# Altium schematic sheet MEASURES.SchDoc
size A4; SheetNumber: 4; SheetTotal: 6
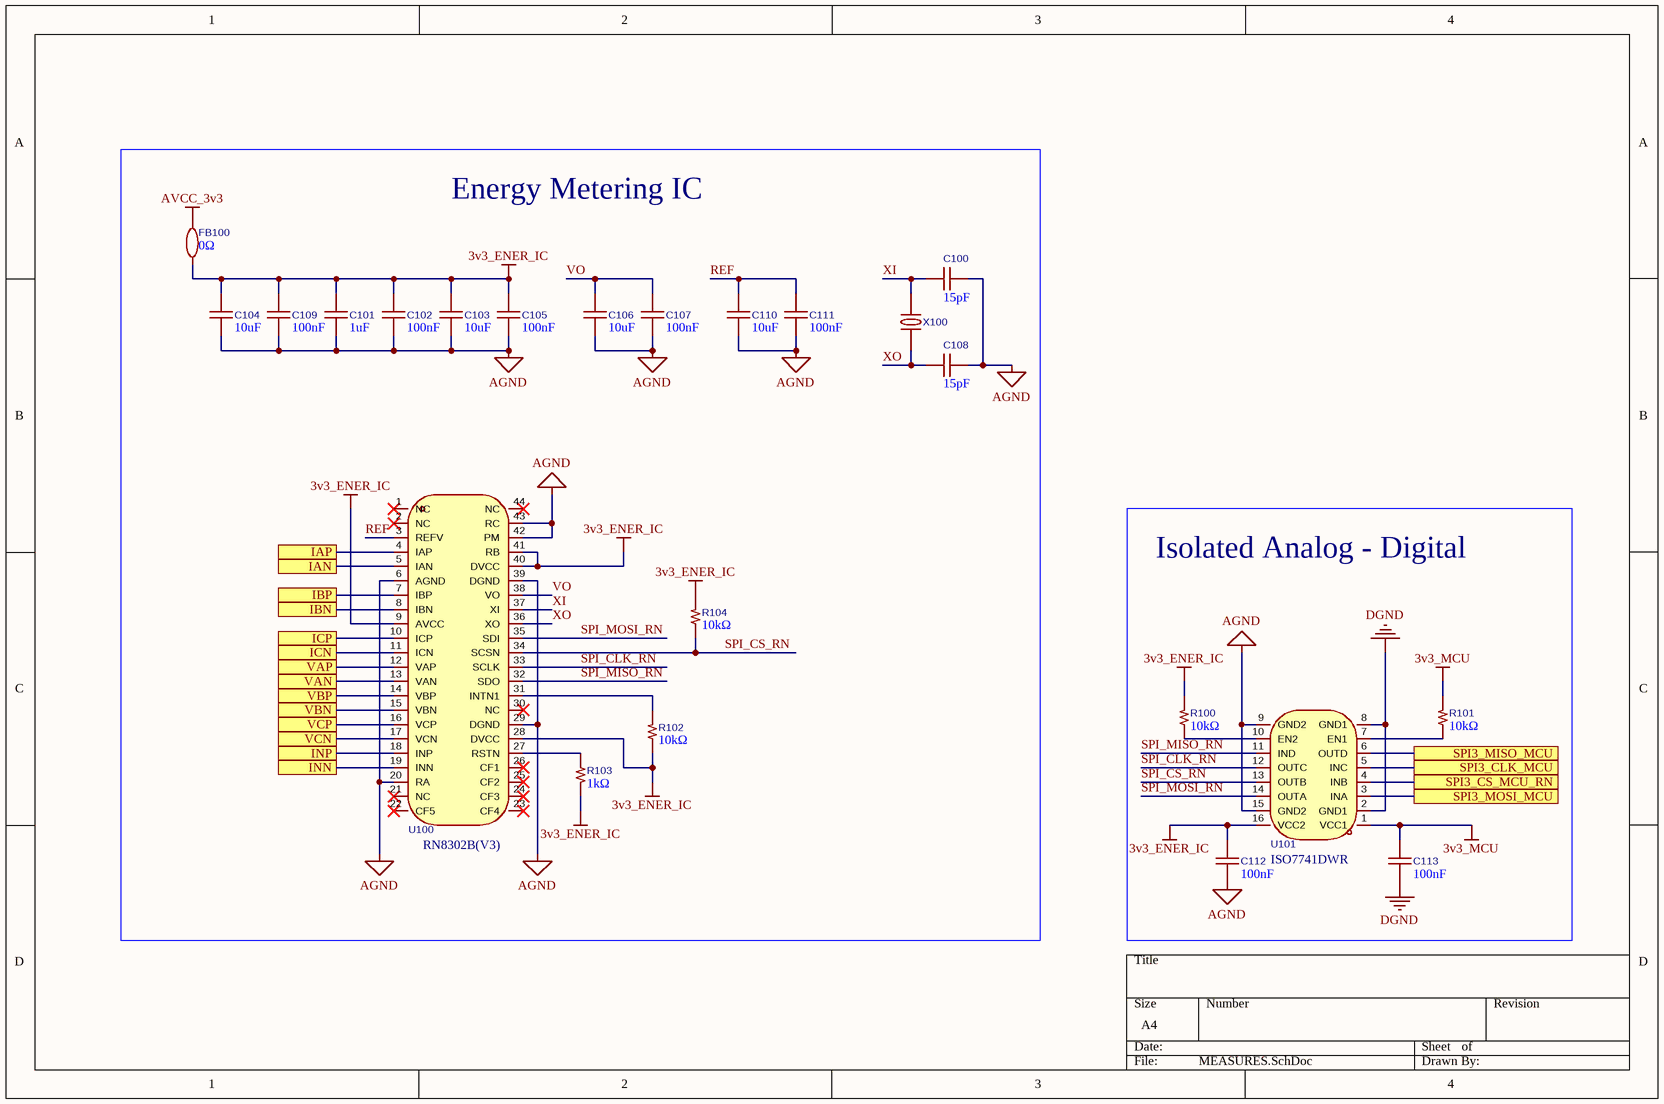
[diagram p0: MEASURES.SchDoc]

## Parts
C100  value 15pF  [0603_cap]  (hidden comment: YAGEO CC0603JRNPO9BN150)
C101  value 1uF  [0603_cap]  (hidden comment: CL10B105KB8NQNC)
C102  value 100nF  [0603_cap]  (hidden comment: AIDE CAPACITOR 0603X7R104K250NT)
C103  value 10uF  [0805_cap]  (hidden comment: muRata GRM21BR61C106KE15L)
C104  value 10uF  [0805_cap]  (hidden comment: muRata GRM21BR61C106KE15L)
C105  value 100nF  [0603_cap]  (hidden comment: AIDE CAPACITOR 0603X7R104K250NT)
C106  value 10uF  [0805_cap]  (hidden comment: muRata GRM21BR61C106KE15L)
C107  value 100nF  [0603_cap]  (hidden comment: AIDE CAPACITOR 0603X7R104K250NT)
C108  value 15pF  [0603_cap]  (hidden comment: YAGEO CC0603JRNPO9BN150)
C109  value 100nF  [0603_cap]  (hidden comment: AIDE CAPACITOR 0603X7R104K250NT)
C110  value 10uF  [0805_cap]  (hidden comment: muRata GRM21BR61C106KE15L)
C111  value 100nF  [0603_cap]  (hidden comment: AIDE CAPACITOR 0603X7R104K250NT)
C112  value 100nF  [0603_cap]  (hidden comment: AIDE CAPACITOR 0603X7R104K250NT)
C113  value 100nF  [0603_cap]  (hidden comment: AIDE CAPACITOR 0603X7R104K250NT)
FB100  value 0Ω  [0603_cap]  (hidden comment: Yanchuang SCBM160808U090T)
R100  value 10kΩ  [0603_RES]  (hidden comment: SAE 1RC0603F1002)
R101  value 10kΩ  [0603_RES]  (hidden comment: SAE 1RC0603F1002)
R102  value 10kΩ  [0603_RES]  (hidden comment: SAE 1RC0603F1002)
R103  value 1kΩ  [0603_RES]  (hidden comment: FOJAN FRC0603F1001TS)
R104  value 10kΩ  [0603_RES]  (hidden comment: SAE 1RC0603F1002)
U100  RN8302B(v3)  [3]
U101  C571196  [SOIC-16_L10.3-W7.5-P1.27-LS10.3-BL]  (value not drawn)
X100  049ss2-8.192f12dzlal  [HC-49S_L11.4-W4.7-LS12.7]  (value not drawn)

## Blocks framed on the sheet
Energy Metering IC: C100-C111 FB100 R102-R104 U100 X100
Isolated Analog - Digital: C112 C113 R100 R101 U101

## Ports
IAN (see MAIN[2C], THREE PHASES[4B]), IAP (see MAIN[2C], THREE PHASES[4A]), IBN (see MAIN[2C], THREE PHASES[4B]), IBP (see MAIN[2C], THREE PHASES[4B]), ICN (see MAIN[2C], THREE PHASES[4C]), ICP (see MAIN[2C], THREE PHASES[4C]), INN (see MAIN[2C], THREE PHASES[4D]), INP (see MAIN[2C], THREE PHASES[4C]), SPI3_CLK_MCU (see MAIN[2C], MCU[3C]), SPI3_CS_MCU_RN (see MAIN[2C], MCU[3C]), SPI3_MISO_MCU (see MAIN[2C], MCU[3C]), SPI3_MOSI_MCU (see MAIN[2C], MCU[3C]), VAN (see MAIN[2B], THREE PHASES[3B]), VAP (see MAIN[2B], THREE PHASES[3B]), VBN (see MAIN[2B], THREE PHASES[3C]), VBP (see MAIN[2B], THREE PHASES[3B]), VCN (see MAIN[2B], THREE PHASES[3C]), VCP (see MAIN[2B], THREE PHASES[3C])

## Nets
3v3_ENER_IC: C101.2 C102.2 C103.2 C104.2 C105.2 C109.2 C112.2 FB100.1 R100.2 R102.1 R103.2 R104.2 U100.9(AVCC) U100.28(DVCC) U100.40(DVCC) U100.41(RB) U101.16(VCC2)
3v3_MCU: C113.2 R101.2 U101.1(VCC1)
AGND: C100.1 C101.1 C102.1 C103.1 C104.1 C105.1 C106.1 C107.1 C108.1 C109.1 C110.1 C111.1 C112.1 U100.6(AGND) U100.20(RA) U100.29(DGND) U100.39(DGND) U100.42(PM) U100.43(RC) U101.9(GND2) U101.15(GND2)
AVCC_3v3: FB100.2
DGND: C113.1 U101.2(GND1) U101.8(GND1)
IAN: U100.5(IAN) ; port IAN
IAP: U100.4(IAP) ; port IAP
IBN: U100.8(IBN) ; port IBN
IBP: U100.7(IBP) ; port IBP
ICN: U100.11(ICN) ; port ICN
ICP: U100.10(ICP) ; port ICP
INN: U100.19(INN) ; port INN
INP: U100.18(INP) ; port INP
REF: C110.2 C111.2 U100.3(REFV)
SPI3_CLK_MCU: U101.5(INC) ; port SPI3_CLK_MCU
SPI3_CS_MCU_RN: U101.4(INB) ; port SPI3_CS_MCU_RN
SPI3_MISO_MCU: U101.6(OUTD) ; port SPI3_MISO_MCU
SPI3_MOSI_MCU: U101.3(INA) ; port SPI3_MOSI_MCU
SPI_CLK_RN: U100.33(SCLK) U101.12(OUTC)
SPI_CS_RN: R104.1 U100.34(SCSN) U101.13(OUTB)
SPI_MISO_RN: U100.32(SDO) U101.11(IND)
SPI_MOSI_RN: U100.35(SDI) U101.14(OUTA)
VAN: U100.13(VAN) ; port VAN
VAP: U100.12(VAP) ; port VAP
VBN: U100.15(VBN) ; port VBN
VBP: U100.14(VBP) ; port VBP
VCN: U100.17(VCN) ; port VCN
VCP: U100.16(VCP) ; port VCP
VO: C106.2 C107.2 U100.38(VO)
XI: C100.2 U100.37(XI) X100.1
XO: C108.2 U100.36(XO) X100.2
NetR100_1: R100.1 U101.10(EN2)
NetR101_1: R101.1 U101.7(EN1)
NetR102_2: R102.2 U100.31(INTN1)
NetR103_1: R103.1 U100.27(RSTN)

Not connected (* = marked no-connect by the designer): U100 1(NC)* 2(NC)* 21(NC)* 22(CF5)* 23(CF4)* 24(CF3)* 25(CF2)* 26(CF1)* 30(NC)* 44(NC)*

## Library data of the parts
C100 C108 = CAP CER 15pF 50V NP0 0603: Capacitance:15pF Tolerance:±5% Tolerance:±5% Voltage Rating:50V Temperature Coefficient:C0G; Manufacturer 1: Chinocera; Manufacturer Part Number 1: HGC0603G0150J500NTHJ; ComponentLink1Description: LCSC; ComponentLink1URL: https://www.lcsc.com/product-detail/C465156.html?s_z=n_q_HGC0603G0150J500NTHJ; Supplier 1: LCSC; Supplier Part Number 1: C465156
C101 = CAP CER 1uF 50V X7R 0603: Capacitance:1uF Tolerance:±20% Tolerance:±20% Voltage Rating:50V Ripple Current:- Equivalent Series Resistance(ESR):- Diameter:4mm Height - Seated (Max):5.4mm Lifetime:1000hrs@105℃ Operating Temperature:-45℃~+105℃ Operating Temperature:-45℃~+105℃; Manufacturer 1: Samsung Electro-Mechanics; ComponentLink1Description: LCSC; ComponentLink1URL: https://www.lcsc.com/es/product-detail/C5199872.html?spm=wm.fly.bg.9.xh&lcsc_vid=ElBYBFACR1JaVQdSQ1NeBFwHFAdfUFIFEwUNXlwCEVQxVlNfRlVWUFNWT1hWUDtW; Supplier 1: LSCS; Supplier Part Number 1: C5199872; Manufacturer Part Number 1: CL10B105KB8NQNC
C102 C105 C107 C109 C111-C113 = CAP CER 100nF 25V X7R 0603: ComponentLink1Description: LCSC; ComponentLink1URL: https://www.lcsc.com/product-detail/C465156.html?s_z=n_q_HGC0603G0150J500NTHJ; Supplier 1: LCSC; Manufacturer 1: AIDE CAPACITOR; Manufacturer Part Number 1: 0603X7R104K250NT; Supplier Part Number 1: C48579280
C103 C104 C106 C110 = CAP CER 10uF 16V X5R 0805: ComponentLink1Description: New link; ComponentLink1URL: https://www.lcsc.com/es/product-detail/C77075.html?spm=wm.fly.bg.11.xh___wm.fly.dhl.mly.13-0-3&lcsc_vid=ElBYBFACR1JaVQdSQ1NeBFwHFAdfUFIFEwUNXlwCEVQxVlNfRlVWUFNWT1hWUDtW; Manufacturer 1: muRata; Manufacturer Part Number 1: GRM21BR61C106KE15L; Supplier Part Number 1: C77075; Supplier 1: LCSC
FB100 = FERR_10mohms 15o@100MHz: 10mΩ 15Ω@100MHz 0603 Ferrite Beads and Chips; ComponentLink1Description: LCSC; ComponentLink1URL: https://www.lcsc.com/es/product-detail/C52205324.html?s_z=s_c_Ferrite%2520Beads%2520and%2520Chips&spm=wm.fly.bg.0.xh&lcsc_vid=T1EMUlBeR1ALUlVSFANeUFcFR1BWV1EHFVFaA1dQElAxVlNfRlJaVFNSQlhYUjsOAxUeFF5JWBYZEEoKFBINSQcJGk4LFEsFFhULAAsUDk5fVlNWWQkaCgg%3D; Supplier 1: LCSC; Supplier Part Number 1: C52205324; Manufacturer 1: Yanchuang; Manufacturer Part Number 1: SCBM160808U090T
R100-R102 R104 = RES_10kohms 100mW 75V: 10kΩ 100mW 75V Thick Film Resistor ±100ppm/℃ ±1% 0603 Chip Resistor - Surface Mount; ComponentLink1Description: New link; ComponentLink1URL: https://www.lcsc.com/es/product-detail/C53224186.html?spm=wm.fly.bg.4.xh___wm.fly.dhl.mly.13-6-1&lcsc_vid=T1EMUlBeR1ALUlVSFANeUFcFR1BWV1EHFVFaA1dQElAxVlNfRlJaV1FUQldbXzsOAxUeFF5JWBYZEEoKFBINSQcJGk4NBhYS; Manufacturer 1: SAE; Manufacturer Part Number 1: 1RC0603F1002; Supplier Part Number 1: C53224186; Supplier 1: LCSC
R103 = RES 1kohms ±1% 100mW 0603: RES 1kΩ ±1% 100mW 0603; ComponentLink1Description: New link; ComponentLink1URL: https://www.lcsc.com/es/product-detail/C2907002.html?spm=wm.fly.bg.1.xh___wm.fly.dhl.mly.13-6-1&lcsc_vid=T1EMUlBeR1ALUlVSFANeUFcFR1BWV1EHFVFaA1dQElAxVlNfRlJaV1FUQldbXzsOAxUeFF5JWBYZEEoKFBINSQcJGk4NBhYS; Supplier 1: LCSC; Supplier Part Number 1: C2907002; Manufacturer Part Number 1: FRC0603F1001TS; Manufacturer 1: FOJAN
U100 = RN8302B(v3): Meter Type:Polyphase Energy Metering IC Number of Channels:- Tolerance:0.1% Voltage - Supply:3V~3.6V Voltage - Supply:3V~3.6V Dynamic Range:10000:1 Interface:SPI Current - Supply:4.4mA Current - Supply:4.4mA Operating Temperature:-40℃~+85℃ Operating Tempe; Manufacturer 1: RENERGY; ComponentLink1Description: LCSC; ComponentLink1URL: https://www.lcsc.com/es/product-detail/C22381391.html?s_z=n_q_rn8302b%28v3%29&spm=wm.fly.bg.0.xh&lcsc_vid=FFRdVwAETgNbVwAHTlRdV1UFEwcIU1ZXQVZZAlYFQAcxVlNfRlJdUlFTRVNXXzsOAxUeFF5JWBYZEEoKFBINSQcJGk4LFEsWBQ4KEgcSWgULEwUPG04tU1VSTllfSQwSGg0%3D; Supplier 1: LCSC; Supplier Part Number 1: C22381391; Manufacturer Part Number 1: RN8302B(V3)
U101 = iso7741dwr: Number of Forward Channels:3 Number of Reverse Channels:1 Data Rate(Max):100Mbps Default Output:High Level Isolation Voltage(Vrms):5000 CMTI(kV/us):100kV/us Propagation Delay(tpd):10.7ns Features:Channel direction configurable；Fail-safe output Voltage - S; Manufacturer 1: TI; ComponentLink1Description: LCSC; ComponentLink1URL: https://www.lcsc.com/es/product-detail/C571196.html?s_z=n_q_iso7741dwr&spm=wm.fly.bg.0.xh&lcsc_vid=FFRdVwAETgNbVwAHTlRdV1UFEwcIU1ZXQVZZAlYFQAcxVlNfRlJdUlZUQVBeVTsOAxUeFF5JWBYZEEoKFBINSQcJGk4LFEsWBQ4KEgcSWgULEwUPG04tUlZRQ1deXlZIHxUDCw%3D%3D; Supplier 1: LCSC; Supplier Part Number 1: C571196; Manufacturer Part Number 1: ISO7741DWR
X100 = Crystal_049ss2: Type:Crystal Oscillator Frequency:8.192MHz Normal temperature Frequency Tolerance:±20ppm Normal temperature Frequency Tolerance:±20ppm Load Capacitance:12pF Frequency Stability:±100ppm Frequency Stability:±100ppm Equivalent Series Resistance(ESR):60Ω Oper; Manufacturer 1: HCI; Value: 8.192MHz; Operating Temperature: -40℃~+125℃; ComponentLink1Description: LCSC; ComponentLink1URL: https://www.lcsc.com/es/product-detail/C19674267.html?s_z=n_q_049ss2-8.192f12dzlal&spm=wm.fly.bg.0.xh&lcsc_vid=FFRdVwAETgNbVwAHTlRdV1UFEwcIU1ZXQVZZAlYFQAcxVlNfRlJdU11WRldaVDsOAxUeFF5JWBYZEEoKFBINSQcJGk4LFEsWBQ4KEgcSWgULEwUPG04tUFBVQVZZVEoOAwwC; Supplier 1: LCSC; Supplier Part Number 1: C19674267; Manufacturer Part Number 1: 049SS2-8.192F12DZLAL